# Altium schematic sheet 05_USB.SchDoc
size A4; SheetNumber: 5; SheetTotal: 12
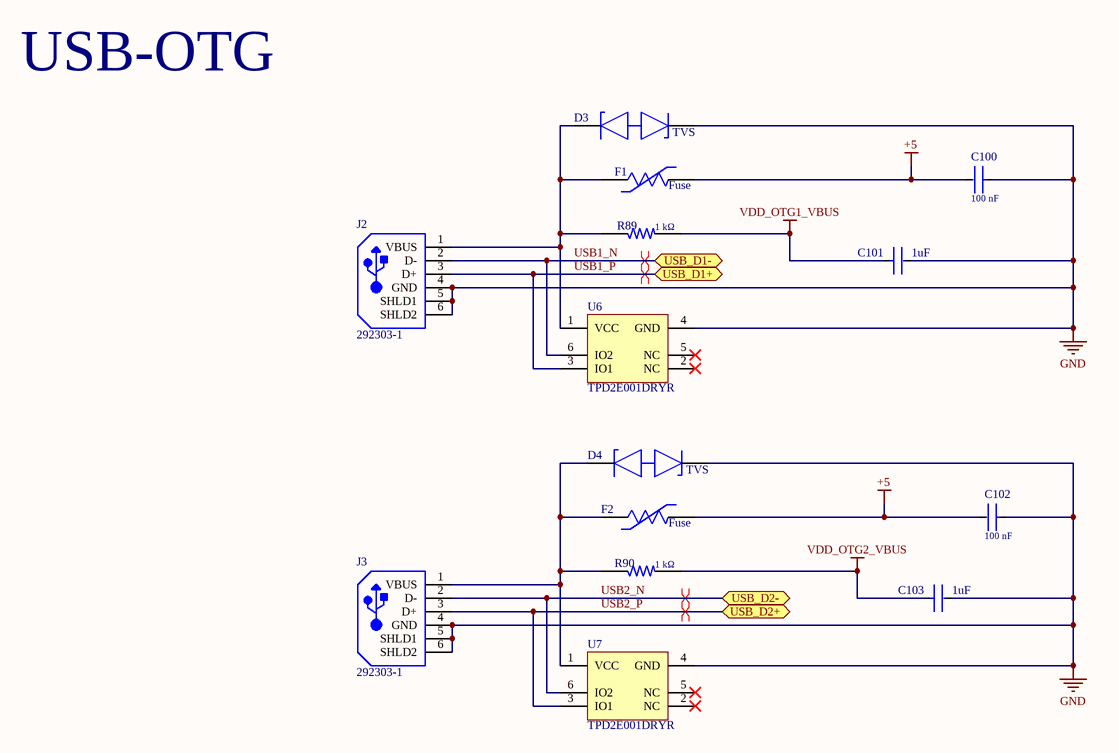
[diagram p0: 05_USB.SchDoc]

## Parts
C100  100 nF  [FP-CC0603-DA-MFG]
C101  1uF  [FP-CC0603-DA-MFG]
C102  100 nF  [FP-CC0603-DA-MFG]
C103  1uF  [FP-CC0603-DA-MFG]
D3  TVS  [FP-SOD323-CA-MFG]
D4  TVS  [FP-SOD323-CA-MFG]
F1  Fuse  [FP-1206L050YR-MFG]
F2  Fuse  [FP-1206L050YR-MFG]
J2  292303-1  [TE-292303-1_V]
J3  292303-1  [TE-292303-1_V]
R89  1 kΩ  [RESC1607X60N]
R90  1 kΩ  [RESC1607X60N]
U6  TPD2E001DRYR  [DRY0006A]
U7  TPD2E001DRYR  [DRY0006A]

## Ports
USB_D1+ (bidir), USB_D1- (bidir), USB_D2+ (bidir), USB_D2- (bidir)

## Nets
+5: C100.2 C102.2 F1.2 F2.2
GND: C100.1 C101.2 C102.1 C103.2 D3.1(K1) D4.1(K1) J2.4(GND) J2.5(SHLD1) J2.6(SHLD2) J3.4(GND) J3.5(SHLD1) J3.6(SHLD2) U6.4(GND) U7.4(GND)
VDD_OTG1_VBUS: C101.1 R89.2
VDD_OTG2_VBUS: C103.1 R90.2
USB1_N: J2.2(D-) U6.6(IO2) ; port USB_D1-
USB1_P: J2.3(D+) U6.3(IO1) ; port USB_D1+
USB2_N: J3.2(D-) U7.6(IO2) ; port USB_D2-
USB2_P: J3.3(D+) U7.3(IO1) ; port USB_D2+
NetD3_2: D3.2(K2) F1.1 J2.1(VBUS) R89.1 U6.1(VCC)
NetD4_2: D4.2(K2) F2.1 J3.1(VBUS) R90.1 U7.1(VCC)

Not connected (* = marked no-connect by the designer): U6 2(NC)* 5(NC)*; U7 2(NC)* 5(NC)*

## Layout directives
differential pair: USB1_N, USB1_P, USB2_N, USB2_P

## Notes on the sheet
- USB-OTG

## Library data of the parts
C100 C102 = CMP-2100-03601-2: CAP CER 0.1UF 50V X7R 0603; Manufacturer: YAGEO; Manufacturer Part Number: CC0603KRX7R9BB104; Material: Ceramic; Temperature Coefficient: 15%; Tolerance: 0.1; Height: 0.9mm; Voltage: 50 V; ComponentLink2Description: Datasheet; Device Class L2: Capacitors; Temperature Range High: +125°C; Category: Cap; Capacitance: 100 nF; Footprint Url: http://www.yageo.com/exep/pages/download/literatures/UPY-C_GEN_24.pdf; ComponentLink2URL: http://www.yageo.com/documents/recent/UPY-GPHC_X7R_6.3V-to-50V_18.pdf; Package: CC0603-DA; Temperature: -55°C to +125°C; Voltage Rating: 50 V; Temperature Characteristic: X7R; Device Class L1: Passive Components; Temperature Range Low: -55°C; RoHS: TRUE; Automotive: No; Value: 100 nF; Device Class L3: Ceramic Capacitors; Octopart: https://octopart.com/cc0603krx7r9bb104-yageo-42244635; Mouser Description: Multilayer Ceramic Capacitor, CC Series, 0.1 - F, - 10%, X7R, 50 V, 0603 [1608 Metric]; Lead Free: Yes; Digikey Description: CAP CER 0.1UF 50V X7R 0603
C101 C103 = CMP-03422-000162-1: 1UF 10V X5R 0603; Manufacturer Part Number: CC0603KRX5R6BB105; Manufacturer: YAGEO; Material: Ceramic; Tolerance: 0.1; Temperature Coefficient: 15%; ComponentLink2Description: Datasheet; Capacitance: 1 uF; Device Class L2: Capacitors; Package: CC0603-DA; Digikey Description: CAP CER 1UF 10V X5R 0603; Device Class L1: Passive Components; Footprint Url: http://www.yageo.com/exep/pages/download/literatures/UPY-C_GEN_24.pdf; Octopart: https://octopart.com/cc0603krx5r6bb105-yageo-8376527; Category: Cap; Voltage: 10 V; Automotive: No; RoHS: TRUE; Temperature Range High: +125°C; ComponentLink2URL: http://www.yageo.com/documents/recent/UPY-GPHC_X7R_6.3V-to-50V_18.pdf; Value: 1 uF; Mouser Description: Multilayer Ceramic Capacitors MLCC - SMD/SMT 1.0uF 10V X5R 10%; Voltage Rating: 10 V; Height: 0.9mm; Temperature Range Low: -55°C; Device Class L3: Ceramic Capacitors; Temperature: -55°C to +125°C; Temperature Characteristic: X5R; Lead Free: Yes
D3 D4 = CMP-14432-000001-1: TVS DIODE 5V 14V SOD323
F1 F2 = CMP-08606-000073-1: PTC RESET FUSE 6V 500MA 1206; Trip Current: 1A; Current Rating: 100A; Resistance: 700mR; Approvals: cULus; Max Power Dissipation: 600mW; Time to Trip: 0.1s; Hold Current: 500mA; Min Operating Temperature: -40°C; Voltage Rating (DC): 6V; Working Voltage: 6V; Package Quantity: 4000; Termination: SMD/SMT; Lead Free: Lead Free; REACH SVHC: No SVHC; Series: 1206L; Max Voltage Rating (DC): 6V; Height: 0.75mm; Terminal Material: Copper; Packaging: Tape and Reel; Case Code (Imperial): 1206; Length: 3.4mm; RoHS Compliant: Yes; Operating Supply Voltage: 6V; Case Code (Metric): 3216; Width: 1.8mm; Max Current Rating: 100A; Case/Package: 1206; Power Dissipation: 600mW; Max Operating Temperature: 85°C; Voltage Rating: 6V
J2 J3 = CMP-2000-05404-1: 1 Port Right Angle Through Hole Mount Female Type A USB Connector, 4 Position, -55 to 85 degC, RoHS, Tube; Manufacturer: TE Connectivity; Contact Termination Type: Solder; No. of Contacts: 4; Connector Mounting: PCB; SVHC: NoSVHC(16-Jun-2014); Gender: Receptacle; Connector Type: USBA; Package Description: 4-Pin Through Hole Device, Body 14 x 13.13 mm, Pitch 2.5 mm; Contact Plating: Gold; Package Reference: 292303-1; Contact Material: Copper; Datasheet URL: http://www.farnell.com/cad/1653030.pdf; Datasheet Version: Feb-12; Manufacturer URL: http://www.te.com/
R89 R90 = RC0603FR-071KL: 1 kOhms Â±1% 0.1W, 1/10W Chip Resistor 0603 (1608 Metric) Moisture Resistant Thick Film; MF: Yageo; SnapEDA_Link: https://www.snapeda.com/parts/RC0603FR-071KL/Yageo/view-part/?ref=snap; Package: 0603 Yageo; Value: *; MP: RC0603FR-071KL; Check_prices: https://www.snapeda.com/parts/RC0603FR-071KL/Yageo/view-part/?ref=eda
U6 U7 = CMP-0326-00025-3: Low-Capacitance + / - 15 kV ESD-Protection Array for High-Speed Data Interfaces, 2 Channels, -40 to +85 degC, 6-pin SON (DRY), Green (RoHS & no Sb/Br); Manufacturer: Texas Instruments; SubFamily: ESD Solution; Breakdown Voltage(Min)(V): 11; IEC 61000-4-2 Contact(+/- kV): 8; IEC 61000-4-2 Air-Gap(+/- kV): 15; IO Leakage Current(nA): 1; IO Capacitance(Typ)(pF): 1.5; USB High Speed: TRUE; Eco-Plan: Green (RoHS & no Sb/Br); PackageReference: DRY0006A; Mounting Technology: Surface Mount; ComponentLink2URL: http://www.ti.com/general/docs/lit/getliterature.tsp?genericPartNumber=TPD2E001&fileType=pdf; ComponentLink3URL: SamplesURL:http://www.ti.com/product/tpd2e001#samples; PackageDescription: 6-Pin Plastic Small Outline No-Lead, 1 x 1.45 x 0.6 mm Body, 0.5 mm Pitch; ComponentLink1Description: Manufacturer URL; PartNumber: TPD2E001DRYR; PackageVersion: revF, Dec-2011; ComponentLink1URL: http://www.ti.com/; ComponentLink2Description: Datasheet; DatasheetVersion: SLLS684F; ComponentLink3Description: URL Link1